# Altium schematic sheet AUDIO - ALC897_3CH.schdoc
size 594 x 421 mm; Symbol: Sheet-Symbol_A2; Company: 嘉立创EDA; Version: V1.0; Page Size: A2; @Project Name: H610(2024/12/09); @Page Count: 36; @Update Date: 2025-10-09; @Create Date: 2025-10-09; @Schematic Name: SCHEMATIC1; @Page No: 20; @Page Name: AUDIO - ALC897_3CH; Device: Sheet-Symbol_A2; @Board Name: SCHEMATIC1; @Create Time: 10:15:41; @Update Time: 10:39:12
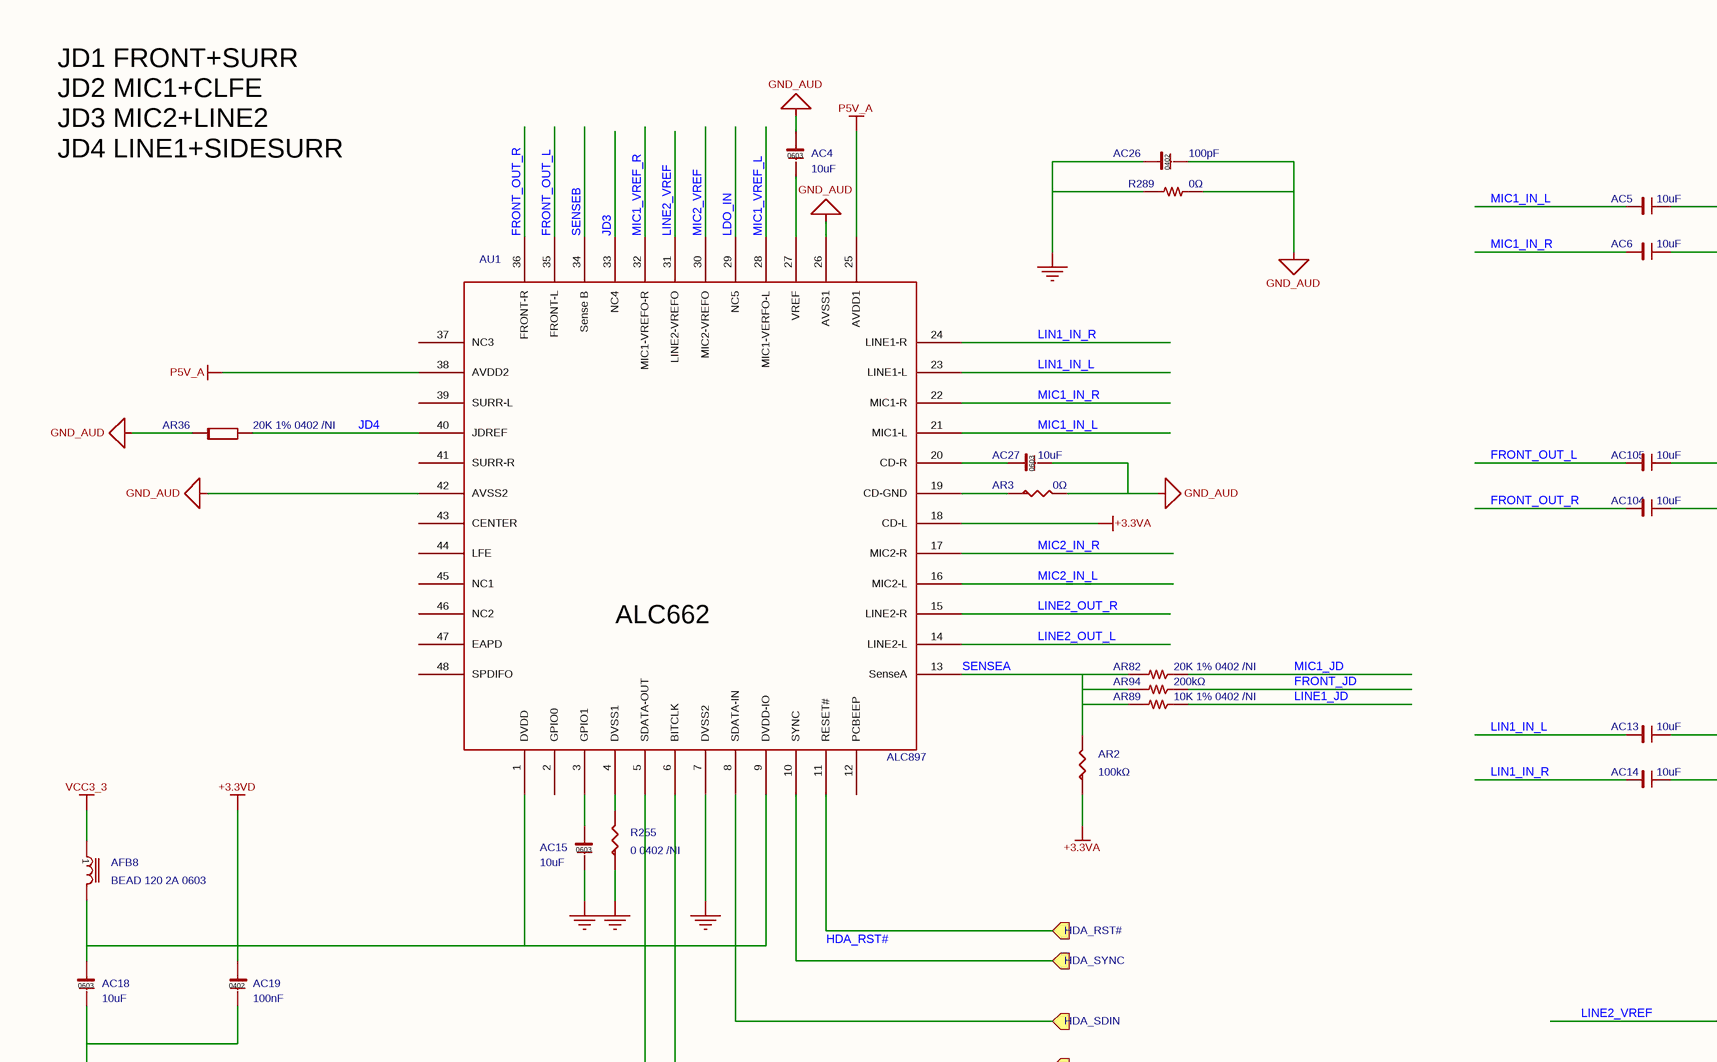
[diagram p0: AUDIO - ALC897_3CH.schdoc, top left]
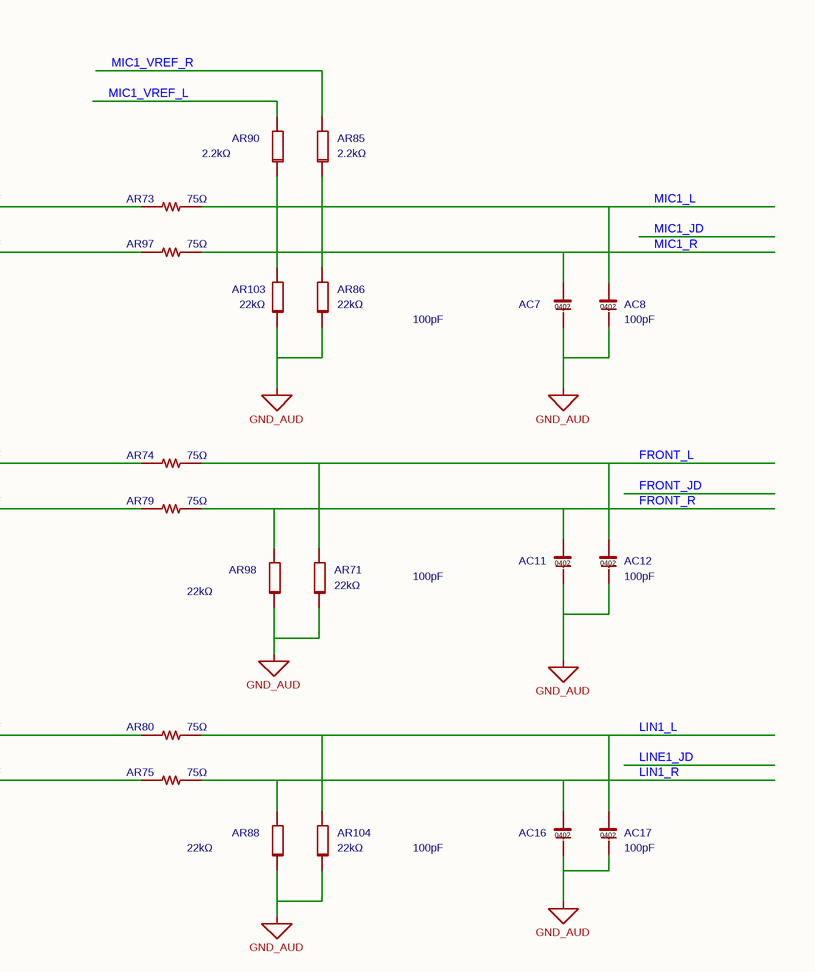
[diagram p1: AUDIO - ALC897_3CH.schdoc, top right]
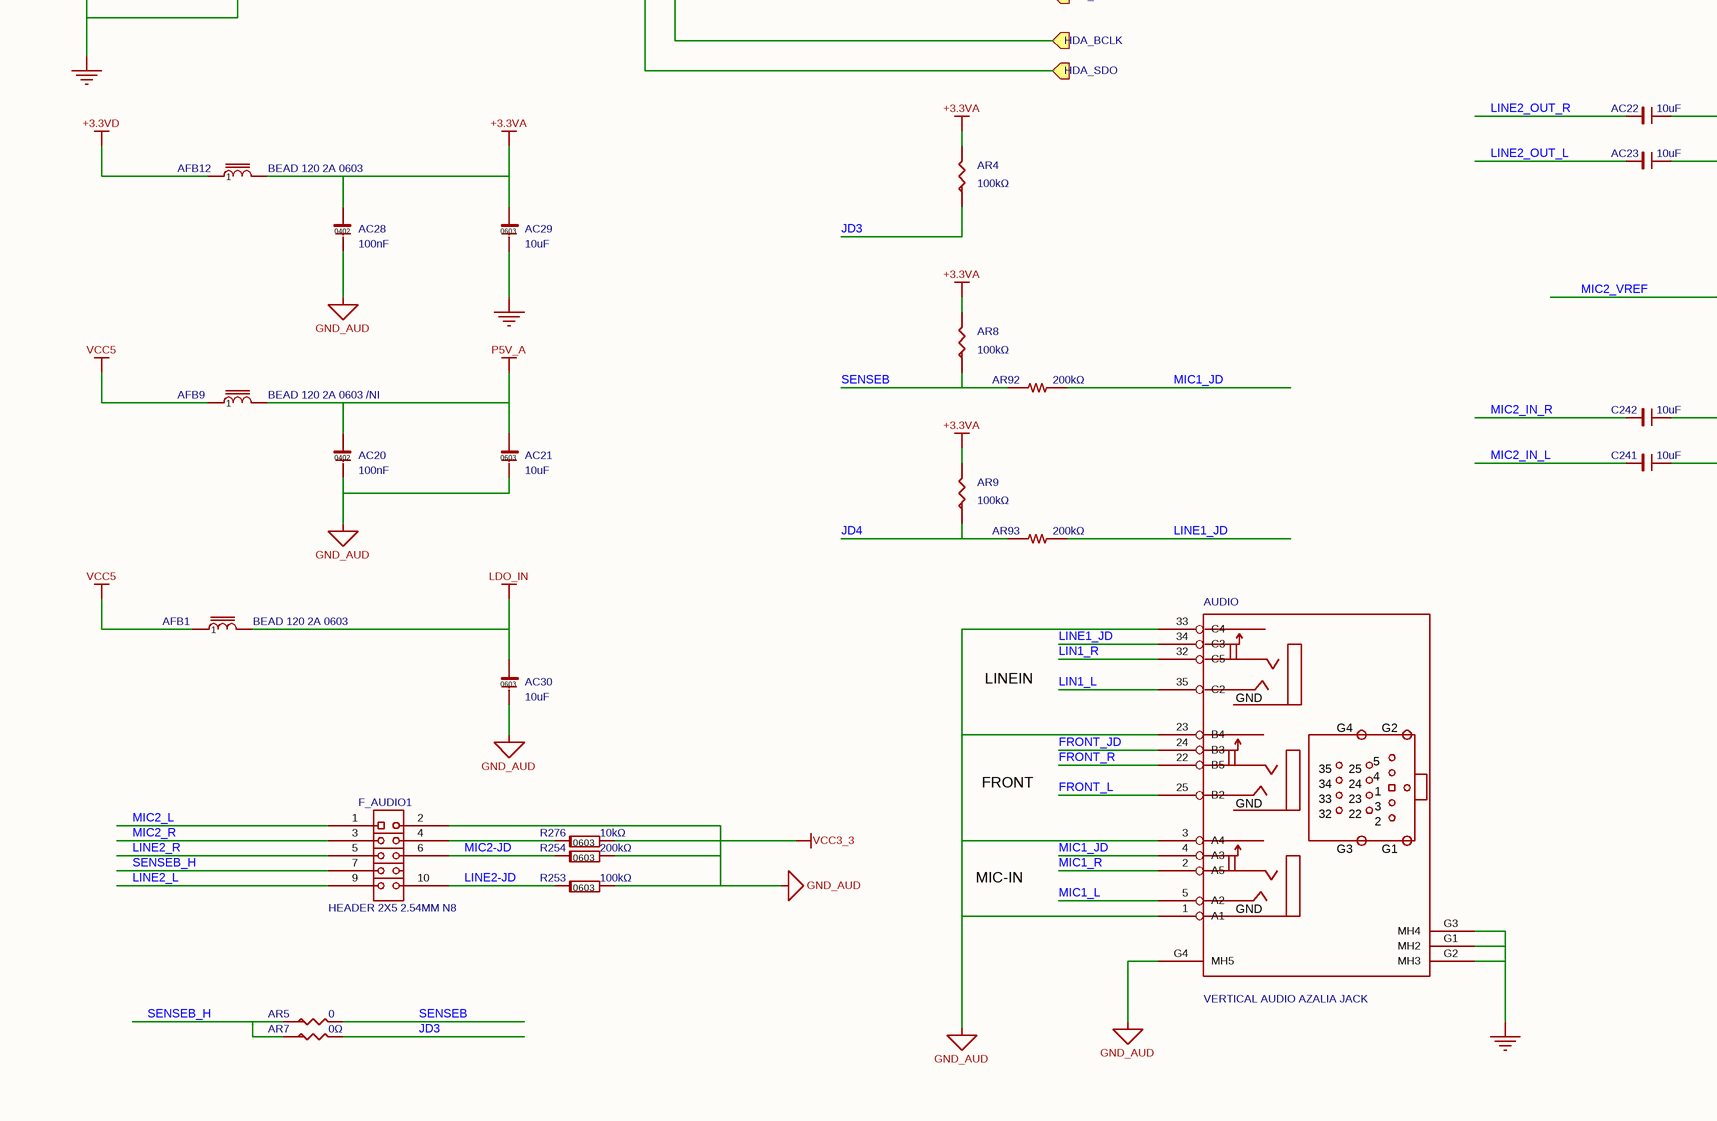
[diagram p2: AUDIO - ALC897_3CH.schdoc, bottom left]
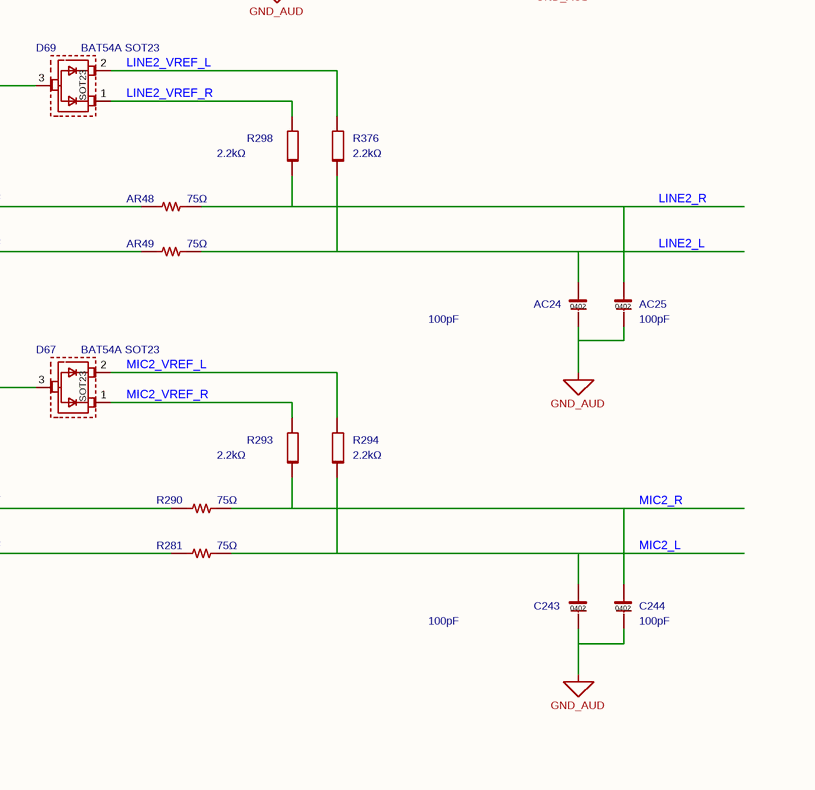
[diagram p3: AUDIO - ALC897_3CH.schdoc, bottom right]

## Parts
AC4  10uF  [C0603]
AC5  10uF  [C0603_1]
AC6  10uF  [C0603_1]
AC7  100pF  [C0402]
AC8  100pF  [C0402_1]
AC11  100pF  [C0402_1]
AC12  100pF  [C0402_1]
AC13  10uF  [C0603_1]
AC14  10uF  [C0603_1]
AC15  10uF  [C0603]
AC16  100pF  [C0402_1]
AC17  100pF  [C0402_1]
AC18  10uF  [C0603]
AC19  100nF  [C0402]
AC20  100nF  [C0402_2]
AC21  10uF  [C0603_2]
AC22  10uF  [C0603_1]
AC23  10uF  [C0603_1]
AC24  100pF  [C0402_2]
AC25  100pF  [C0402_2]
AC26  100pF  [C0402_2]
AC27  10uF  [C0603_1]
AC28  100nF  [C0402_2]
AC29  10uF  [C0603_1]
AC30  10uF  [C0603_3]
AC104  10uF  [C0603_3]
AC105  10uF  [C0603_3]
AFB1  value BEAD 120 2A 0603  [FB0603_2]  (hidden comment: FERRITE BEAD)
AFB8  value BEAD 120 2A 0603  [FB0603]  (hidden comment: FERRITE BEAD)
AFB9  value BEAD 120 2A 0603 /NI  [FB0603_1]  (hidden comment: FERRITE BEAD)
AFB12  value BEAD 120 2A 0603  [FB0603_2]  (hidden comment: FERRITE BEAD)
AR2  100kΩ  [R0402]
AR3  0Ω  [R0402_1]
AR4  100kΩ  [R0402_2]
AR5  value 0  [R0402_2]  (hidden comment: RESISTOR)
AR7  0Ω  [R0402]
AR8  100kΩ  [R0402]
AR9  100kΩ  [R0402_3]
AR36  value 20K 1% 0402 /NI  [R0402_1]  (hidden comment: R0402)
AR48  75Ω  [R0402_3]
AR49  75Ω  [R0402_3]
AR71  22kΩ  [R0402_1]
AR73  75Ω  [R0402_2]
AR74  75Ω  [R0402_3]
AR75  75Ω  [R0402_3]
AR79  75Ω  [R0402_3]
AR80  75Ω  [R0402_3]
AR82  value 20K 1% 0402 /NI  [R0402_2]  (hidden comment: 10_R_0)
AR85  2.2kΩ  [R0402_2]
AR86  22kΩ  [R0402]
AR88  22kΩ  [R0402_1]
AR89  value 10K 1% 0402 /NI  [R0402_2]  (hidden comment: 10_R_0)
AR90  2.2kΩ  [R0402_2]
AR92  200kΩ  [R0402_2]
AR93  200kΩ  [R0402_3]
AR94  200kΩ  [R0402_2]
AR97  75Ω  [R0402_2]
AR98  22kΩ  [R0402_1]
AR103  22kΩ  [R0402_2]
AR104  22kΩ  [R0402_1]
AU1  value ALC897  [LQFP48]  (hidden comment: ALC662_1)
AUDIO  value VERTICAL AUDIO AZALIA JACK  [AUDIO_V]  (hidden comment: ABA-JAK-027-K24)
C241  10uF  [C0603_1]
C242  10uF  [C0603_1]
C243  100pF  [C0402_2]
C244  100pF  [C0402_2]
D67  value BAT54A SOT23  [SOT23_124]  (hidden comment: BAT54A)
D69  value BAT54A SOT23  [SOT23_124]  (hidden comment: BAT54A)
F_AUDIO1  value HEADER 2X5 2.54MM N8  [PIN2X5_2D54_NC8]  (hidden comment: 210-82-05GB06)
R253  100kΩ  [R0402_1]
R254  200kΩ  [R0402_1]
R255  value 0 0402 /NI  [R0402]  (hidden comment: R)
R276  10kΩ  [R0402_1]
R281  75Ω  [R0402_3]
R289  0Ω  [R0603_2]
R290  75Ω  [R0402_3]
R293  2.2kΩ  [R0402]
R294  2.2kΩ  [R0402]
R298  2.2kΩ  [R0402]
R376  2.2kΩ  [R0402]

## Ports
HDA_BCLK (in), HDA_RST# (in), HDA_SDIN (in), HDA_SDO (in), HDA_SYNC (in)

## Nets
+3.3VA: AC28.1 AC29.1 AFB12.2 AR2.1 AR4.2 AR8.2 AR9.2 AU1.18(CD-L)
+3.3VD: AC18.1 AC19.1 AFB8.2 AFB12.1 AU1.1(DVDD) AU1.9(DVDD-IO)
GND: AC15.2 AC18.2 AC19.2 AC26.1 AC29.2 AU1.7(DVSS2) AUDIO.G1(MH2) AUDIO.G2(MH3) AUDIO.G3(MH4) R255.1 R289.1
GND_AUD: AC4.1 AC7.2 AC8.2 AC11.2 AC12.2 AC16.2 AC17.2 AC20.2 AC21.2 AC24.2 AC25.2 AC26.2 AC27.2 AC28.2 AC30.2 AR3.2 AR36.1 AR71.1 AR86.1 AR88.1 AR98.1 AR103.1 AR104.1 AU1.26(AVSS1) AU1.42(AVSS2) AUDIO.1(A1) AUDIO.3(A4) AUDIO.23(B4) AUDIO.33(C4) AUDIO.G4(MH5) C243.2 C244.2 F_AUDIO1.2 R253.2 R254.2 R289.2
LDO_IN: AC30.1 AFB1.2 AU1.29(NC5)
P5V_A: AC20.1 AC21.1 AFB9.2 AU1.25(AVDD1) AU1.38(AVDD2)
VCC3_3: AFB8.1 R276.2
VCC5: AFB1.1 AFB9.1
FRONT_JD: AR94.2 AUDIO.24(B3)
FRONT_L: AC12.1 AR71.2 AR74.1 AUDIO.25(B2)
FRONT_OUT_L: AC105.1 AU1.35(FRONT-L)
FRONT_OUT_R: AC104.1 AU1.36(FRONT-R)
FRONT_R: AC11.1 AR79.1 AR98.2 AUDIO.22(B5)
HDA_BCLK: AU1.6(BITCLK) ; port HDA_BCLK
HDA_RST#: AU1.11(RESET#) ; port HDA_RST#
HDA_SDIN: AU1.8(SDATA-IN) ; port HDA_SDIN
HDA_SDO: AU1.5(SDATA-OUT) ; port HDA_SDO
HDA_SYNC: AU1.10(SYNC) ; port HDA_SYNC
JD3: AR4.1 AR7.2 AU1.33(NC4)
JD4: AR9.1 AR36.2 AR93.1 AU1.40(JDREF)
LIN1_IN_L: AC13.1 AU1.23(LINE1-L)
LIN1_IN_R: AC14.1 AU1.24(LINE1-R)
LIN1_L: AC17.1 AR80.1 AR104.2 AUDIO.35(C2)
LIN1_R: AC16.1 AR75.1 AR88.2 AUDIO.32(C5)
LINE1_JD: AR89.2 AR93.2 AUDIO.34(C3)
LINE2-JD: F_AUDIO1.10 R253.1
LINE2_L: AC24.1 AR49.1 F_AUDIO1.9 R376.1
LINE2_OUT_L: AC23.1 AU1.14(LINE2-L)
LINE2_OUT_R: AC22.1 AU1.15(LINE2-R)
LINE2_R: AC25.1 AR48.1 F_AUDIO1.5 R298.1
LINE2_VREF: AU1.31(LINE2-VREFO) D69.3
LINE2_VREF_L: D69.2 R376.2
LINE2_VREF_R: D69.1 R298.2
MIC1_IN_L: AC5.1 AU1.21(MIC1-L)
MIC1_IN_R: AC6.1 AU1.22(MIC1-R)
MIC1_JD: AR82.2 AR92.2 AUDIO.4(A3)
MIC1_L: AC8.1 AR73.1 AR90.1 AR103.2 AUDIO.5(A2)
MIC1_R: AC7.1 AR85.1 AR86.2 AR97.1 AUDIO.2(A5)
MIC1_VREF_L: AR90.2 AU1.28(MIC1-VERFO-L)
MIC1_VREF_R: AR85.2 AU1.32(MIC1-VREFO-R)
MIC2-JD: F_AUDIO1.6 R254.1
MIC2_IN_L: AU1.16(MIC2-L) C241.1
MIC2_IN_R: AU1.17(MIC2-R) C242.1
MIC2_L: C243.1 F_AUDIO1.1 R281.1 R294.1
MIC2_R: C244.1 F_AUDIO1.3 R290.1 R293.1
MIC2_VREF: AU1.30(MIC2-VREFO) D67.3
MIC2_VREF_L: D67.2 R294.2
MIC2_VREF_R: D67.1 R293.2
SENSEA: AR2.2 AR82.1 AR89.1 AR94.1 AU1.13(SenseA)
SENSEB: AR5.2 AR8.1 AR92.1 AU1.34(Sense_B)
SENSEB_H: AR5.1 AR7.1 F_AUDIO1.7
NetAC4_2: AC4.2 AU1.27(VREF)
NetAC5_2: AC5.2 AR73.2
NetAC6_2: AC6.2 AR97.2
NetAC13_2: AC13.2 AR80.2
NetAC14_2: AC14.2 AR75.2
NetAC15_1: AC15.1 AU1.3(GPIO1)
NetAC22_2: AC22.2 AR48.2
NetAC23_2: AC23.2 AR49.2
NetAC27_1: AC27.1 AU1.20(CD-R)
NetAC104_2: AC104.2 AR79.2
NetAC105_2: AC105.2 AR74.2
NetAR3_1: AR3.1 AU1.19(CD-GND)
NetAU1_4: AU1.4(DVSS1) R255.2
NetC241_2: C241.2 R281.2
NetC242_2: C242.2 R290.2
NetF_AUDIO1_4: F_AUDIO1.4 R276.1

Not connected (* = marked no-connect by the designer): AU1 2(GPIO0) 12(PCBEEP) 37(NC3) 39(SURR-L) 41(SURR-R) 43(CENTER) 44(LFE) 45(NC1) 46(NC2) 47(EAPD) 48(SPDIFO)

## Notes on the sheet
- JD1 FRONT+SURR
  JD2 MIC1+CLFE
  JD3 MIC2+LINE2
  JD4 LINE1+SIDESURR
- LINEIN
- FRONT
- MIC-IN
- 更新日期
- 2025-10-09
- 原理图
- 图页
- SCHEMATIC1
- AUDIO - ALC897_3CH
- 创建日期
- 物料编码
- 审阅
- 绘制
- H610(2024/12/09)
- 版本
- V1.0
- 尺寸
- A2
- 页
- 20
- 嘉立创EDA
- 共
- 36
- (in symbol 0402WGF1002TCE) 0603
- (in symbol 0402WGF1003TCE) 0603
- (in symbol 0402WGF2003TCE) 0603
- (in symbol ABA-JAK-027-K24) GND
- (in symbol ALC662_1) ALC662
- (in symbol BAT54A_C727124) SOT23
- (in symbol CL05A106MQ5NUNC) 0603

## Library data of the parts
AC4 AC15 AC18 = CL05A106MQ5NUNC: 容值:10uF;精度:±20%;额定电压:6.3V;材质(温度系数):X5R;; Manufacturer: SAMSUNG(三星); ModelId: 36a51122f27c49738f86b3bfa98863e0; Tolerance: ±20%; AddInBom: yes; Voltage Rated: 6.3V; ModelName: C0402_L1.0-W0.5-H0.5; ModelTransform: 39.37,19.685,0,0,0,0,0,0,0; Temperature Coefficient: X5R; Device: CL05A106MQ5NUNC; Symbol: C0603; Value: 10uF; Supplier: LCSC; Datasheet: https://atta.szlcsc.com/upload/public/pdf/source/20220823/2B02EE04F8F211D38A52DCB16EB6BEBA.pdf; FootprintName: C0603; SupplierPart: C15525; ConvertToPcb: yes; LCSC Part Name: 10uF ±20% 6.3V; JLCPCB Part Class: Basic Part; ManufacturerPart: CL05A106MQ5NUNC; Supplier Footprint: 0402
AC5 AC6 AC13 AC14 AC22 AC23 AC104 AC105 C241 C242 = CL10A106KP8NNNC: 容值:10uF;精度:±10%;额定电压:10V;材质(温度系数):X5R;; Manufacturer: SAMSUNG(三星); Symbol: C0805; ModelId: ac125912035d415993ca9572d50418b1; Tolerance: ±10%; AddInBom: yes; Voltage Rated: 10V; ModelName: C0603_L1.6-W0.8-H0.8; ModelTransform: 62.992,31.496,0,0,0,0,0,0,0; Temperature Coefficient: X5R; Device: CL10A106KP8NNNC; Value: 10uF; Supplier: LCSC; Datasheet: https://atta.szlcsc.com/upload/public/pdf/source/20160103/1457707703378.pdf; SupplierPart: C19702; ConvertToPcb: yes; LCSC Part Name: 10uF ±10% 10V; JLCPCB Part Class: Basic Part; ManufacturerPart: CL10A106KP8NNNC; Supplier Footprint: 0603
  AC5 AC6 AC13 AC14 AC22 AC23 C241 C242: FootprintName: C0603_1
  AC104 AC105: FootprintName: C0603_3
AC7 = 0402CG101J500NT: 容值:100pF;精度:±5%;额定电压:50V;材质(温度系数):C0G;; Manufacturer: FH(风华); ModelId: 36a51122f27c49738f86b3bfa98863e0; Tolerance: ±5%; AddInBom: yes; Voltage Rated: 50V; ModelName: C0402_L1.0-W0.5-H0.5; ModelTransform: 39.37,19.685,0,0,0,0,0,0,0; Temperature Coefficient: C0G; Device: 0402CG101J500NT; Symbol: C0402; Value: 100pF; Supplier: LCSC; FootprintName: C0402; SupplierPart: C1546; ConvertToPcb: yes; LCSC Part Name: 100pF ±5% 50V; JLCPCB Part Class: Basic Part; ManufacturerPart: 0402CG101J500NT; Supplier Footprint: 0402
AC8 AC11 AC12 AC16 AC17 AC24-AC26 C243 C244 = 0402CG101J500NT: 容值:100pF;精度:±5%;额定电压:50V;材质(温度系数):C0G;; Manufacturer: FH(风华); Symbol: C0402; ModelId: 36a51122f27c49738f86b3bfa98863e0; Tolerance: ±5%; AddInBom: yes; Voltage Rated: 50V; ModelName: C0402_L1.0-W0.5-H0.5; ModelTransform: 39.37,19.685,0,0,0,0,0,0,0; Temperature Coefficient: C0G; Device: 0402CG101J500NT; Value: 100pF; Supplier: LCSC; SupplierPart: C1546; ConvertToPcb: yes; LCSC Part Name: 100pF ±5% 50V; JLCPCB Part Class: Basic Part; ManufacturerPart: 0402CG101J500NT; Supplier Footprint: 0402
  AC8 AC11 AC12 AC16 AC17: FootprintName: C0402_1
  AC24-AC26 C243 C244: FootprintName: C0402_2
AC19 = CL05B104KO5NNNC: 容值:100nF;精度:±10%;额定电压:16V;材质(温度系数):X7R;; Manufacturer: SAMSUNG(三星); ModelId: 36a51122f27c49738f86b3bfa98863e0; Tolerance: ±10%; AddInBom: yes; Voltage Rated: 16V; ModelName: C0402_L1.0-W0.5-H0.5; ModelTransform: 39.37,19.685,0,0,0,0,0,0,0; Temperature Coefficient: X7R; Device: CL05B104KO5NNNC; Symbol: C0402; Value: 100nF; Supplier: LCSC; Datasheet: https://atta.szlcsc.com/upload/public/pdf/source/20160103/1457707674891.pdf; FootprintName: C0402; SupplierPart: C1525; ConvertToPcb: yes; LCSC Part Name: 100nF ±10% 16V; JLCPCB Part Class: Basic Part; ManufacturerPart: CL05B104KO5NNNC; Supplier Footprint: 0402
AC20 AC28 = CL05B104KO5NNNC: 容值:100nF;精度:±10%;额定电压:16V;材质(温度系数):X7R;; Manufacturer: SAMSUNG(三星); Symbol: C0402; ModelId: 36a51122f27c49738f86b3bfa98863e0; Tolerance: ±10%; AddInBom: yes; Voltage Rated: 16V; ModelName: C0402_L1.0-W0.5-H0.5; ModelTransform: 39.37,19.685,0,0,0,0,0,0,0; Temperature Coefficient: X7R; Device: CL05B104KO5NNNC; Value: 100nF; Supplier: LCSC; Datasheet: https://atta.szlcsc.com/upload/public/pdf/source/20160103/1457707674891.pdf; FootprintName: C0402_2; SupplierPart: C1525; ConvertToPcb: yes; LCSC Part Name: 100nF ±10% 16V; JLCPCB Part Class: Basic Part; ManufacturerPart: CL05B104KO5NNNC; Supplier Footprint: 0402
AC21 AC27 AC29 AC30 = CL05A106MQ5NUNC: 容值:10uF;精度:±20%;额定电压:6.3V;材质(温度系数):X5R;; Manufacturer: SAMSUNG(三星); Symbol: C0603; ModelId: 36a51122f27c49738f86b3bfa98863e0; Tolerance: ±20%; AddInBom: yes; Voltage Rated: 6.3V; ModelName: C0402_L1.0-W0.5-H0.5; ModelTransform: 39.37,19.685,0,0,0,0,0,0,0; Temperature Coefficient: X5R; Device: CL05A106MQ5NUNC; Value: 10uF; Supplier: LCSC; Datasheet: https://atta.szlcsc.com/upload/public/pdf/source/20220823/2B02EE04F8F211D38A52DCB16EB6BEBA.pdf; SupplierPart: C15525; ConvertToPcb: yes; LCSC Part Name: 10uF ±20% 6.3V; JLCPCB Part Class: Basic Part; ManufacturerPart: CL05A106MQ5NUNC; Supplier Footprint: 0402
  AC21: FootprintName: C0603_2
  AC27 AC29: FootprintName: C0603_1
  AC30: FootprintName: C0603_3
AFB1 AFB12 = FERRITE BEAD: Check: false; AddInBom: yes; Device: FERRITE BEAD; Symbol: FERRITE BEAD; FootprintName: FB0603_2; ConvertToPcb: yes
AFB8 = FERRITE BEAD_1: Check: false; AddInBom: yes; Device: FERRITE BEAD_1; Symbol: FERRITE BEAD; FootprintName: FB0603; ConvertToPcb: yes
AFB9 = FERRITE BEAD_2: BEAD 120 2A 0603 /NI; Check: false; AddInBom: yes; Device: FERRITE BEAD_2; Symbol: FERRITE BEAD; FootprintName: FB0603_1; ConvertToPcb: yes
AR2 AR4 AR8 AR9 = 0402WGF1003TCE: 电阻类型:厚膜电阻;阻值:100kΩ;精度:±1%;功率:62.5mW;; Manufacturer: UNI-ROYAL(厚声); Symbol: RESISTOR; ModelId: 671aefced39d4c318694bba8bd8efd39; Tolerance: ±1%; AddInBom: yes; Power(Watts): 62.5mW; ModelName: R0402_L1.0-W0.5-H0.5; ModelTransform: 39.37,19.685,0,0,0,0,0,0.0005,0; Overload Voltage (Max): 50V; Temperature Coefficient: ±100ppm/℃; Device: 0402WGF1003TCE; Value: 100kΩ; Type: 厚膜电阻; Supplier: LCSC; Datasheet: https://atta.szlcsc.com/upload/public/pdf/source/20200306/C422600_1E6D84923E4A46A82E41ADD87F860B5C.pdf; SupplierPart: C25741; ConvertToPcb: yes; LCSC Part Name: 100kΩ ±1% 62.5mW; JLCPCB Part Class: Basic Part; ManufacturerPart: 0402WGF1003TCE; Supplier Footprint: 0402; Operating Temperature Range: -55℃~+155℃
  AR2 AR8: FootprintName: R0402
  AR4: FootprintName: R0402_2
  AR9: FootprintName: R0402_3
AR3 AR7 = 0402WGF0000TCE: 电阻类型:厚膜电阻;阻值:0Ω;精度:±1%;功率:62.5mW;; Manufacturer: UNI-ROYAL(厚声); Symbol: RESISTOR; ModelId: 671aefced39d4c318694bba8bd8efd39; Tolerance: ±1%; AddInBom: yes; Power(Watts): 62.5mW; ModelName: R0402_L1.0-W0.5-H0.5; ModelTransform: 39.37,19.685,0,0,0,0,0,0.0005,0; Overload Voltage (Max): 50V; Temperature Coefficient: ±800ppm/℃; Device: 0402WGF0000TCE; Value: 0Ω; Type: 厚膜电阻; Supplier: LCSC; Datasheet: https://atta.szlcsc.com/upload/public/pdf/source/20200306/C422600_1E6D84923E4A46A82E41ADD87F860B5C.pdf; SupplierPart: C17168; ConvertToPcb: yes; LCSC Part Name: 0Ω ±1% 62.5mW; JLCPCB Part Class: Basic Part; ManufacturerPart: 0402WGF0000TCE; Supplier Footprint: 0402; Operating Temperature Range: -55℃~+155℃
  AR3: FootprintName: R0402_1
  AR7: FootprintName: R0402
AR5 = RESISTOR: 0 0402 /NI 选焊; Check: false; AddInBom: yes; Device: RESISTOR; Symbol: RESISTOR; FootprintName: R0402_2; ConvertToPcb: yes
AR36 = R0402: 20K 1% 0402 /NI; Check: false; AddInBom: yes; Device: R0402; Symbol: R0402; ConvertToPcb: yes; FootprintName: R0402_1
AR48 AR49 AR73-AR75 AR79 AR80 AR97 R281 R290 = 0402WGF750JTCE: 电阻类型:厚膜电阻;阻值:75Ω;精度:±1%;功率:62.5mW;; Manufacturer: UNI-ROYAL(厚声); Symbol: R_3; ModelId: 671aefced39d4c318694bba8bd8efd39; Tolerance: ±1%; AddInBom: yes; Power(Watts): 62.5mW; ModelName: R0402_L1.0-W0.5-H0.5; ModelTransform: 39.37,19.685,0,0,0,0,0,0.0005,0; Overload Voltage (Max): 50V; Temperature Coefficient: ±100ppm/℃; Device: 0402WGF750JTCE; Value: 75Ω; Type: 厚膜电阻; Supplier: LCSC; Datasheet: https://atta.szlcsc.com/upload/public/pdf/source/20200306/C422600_1E6D84923E4A46A82E41ADD87F860B5C.pdf; SupplierPart: C25133; ConvertToPcb: yes; LCSC Part Name: 75Ω ±1% 62.5mW; JLCPCB Part Class: Basic Part; ManufacturerPart: 0402WGF750JTCE; Supplier Footprint: 0402; Operating Temperature Range: -55℃~+155℃
  AR48 AR49 AR74 AR75 AR79 AR80 R281 R290: FootprintName: R0402_3
  AR73 AR97: FootprintName: R0402_2
AR71 AR88 AR98 AR103 AR104 = 0402WGF2202TCE: 电阻类型:厚膜电阻;阻值:22kΩ;精度:±1%;功率:62.5mW;; Manufacturer: UNI-ROYAL(厚声); Symbol: R0402; ModelId: 671aefced39d4c318694bba8bd8efd39; Tolerance: ±1%; AddInBom: yes; Power(Watts): 62.5mW; ModelName: R0402_L1.0-W0.5-H0.5; ModelTransform: 39.37,19.685,0,0,0,0,0,0.0005,0; Overload Voltage (Max): 50V; Temperature Coefficient: ±100ppm/℃; Device: 0402WGF2202TCE; Value: 22kΩ; Type: 厚膜电阻; Supplier: LCSC; Datasheet: https://atta.szlcsc.com/upload/public/pdf/source/20200306/C422600_1E6D84923E4A46A82E41ADD87F860B5C.pdf; SupplierPart: C25768; ConvertToPcb: yes; LCSC Part Name: 22kΩ ±1% 62.5mW; JLCPCB Part Class: Basic Part; ManufacturerPart: 0402WGF2202TCE; Supplier Footprint: 0402; Operating Temperature Range: -55℃~+155℃
  AR71 AR88 AR98 AR104: FootprintName: R0402_1
  AR103: FootprintName: R0402_2
AR82 = 10_R_0: Check: false; AddInBom: yes; Device: 10_R_0; Symbol: 10_R_0; FootprintName: R0402_2; ConvertToPcb: yes
AR85 AR90 = 0402WGF2201TCE: 电阻类型:厚膜电阻;阻值:2.2kΩ;精度:±1%;功率:62.5mW;; Manufacturer: UNI-ROYAL(厚声); Symbol: R0402; ModelId: 671aefced39d4c318694bba8bd8efd39; Tolerance: ±1%; AddInBom: yes; Power(Watts): 62.5mW; ModelName: R0402_L1.0-W0.5-H0.5; ModelTransform: 39.37,19.685,0,0,0,0,0,0.0005,0; Overload Voltage (Max): 50V; Temperature Coefficient: ±100ppm/℃; Device: 0402WGF2201TCE; Value: 2.2kΩ; Type: 厚膜电阻; Supplier: LCSC; Datasheet: https://atta.szlcsc.com/upload/public/pdf/source/20200306/C422600_1E6D84923E4A46A82E41ADD87F860B5C.pdf; FootprintName: R0402_2; SupplierPart: C25879; ConvertToPcb: yes; LCSC Part Name: 2.2kΩ ±1% 62.5mW; JLCPCB Part Class: Basic Part; ManufacturerPart: 0402WGF2201TCE; Supplier Footprint: 0402; Operating Temperature Range: -55℃~+155℃
AR86 = 0402WGF2202TCE: 电阻类型:厚膜电阻;阻值:22kΩ;精度:±1%;功率:62.5mW;; Manufacturer: UNI-ROYAL(厚声); ModelId: 671aefced39d4c318694bba8bd8efd39; Tolerance: ±1%; AddInBom: yes; Power(Watts): 62.5mW; ModelName: R0402_L1.0-W0.5-H0.5; ModelTransform: 39.37,19.685,0,0,0,0,0,0.0005,0; Overload Voltage (Max): 50V; Temperature Coefficient: ±100ppm/℃; Device: 0402WGF2202TCE; Symbol: R0402; Value: 22kΩ; Type: 厚膜电阻; Supplier: LCSC; Datasheet: https://atta.szlcsc.com/upload/public/pdf/source/20200306/C422600_1E6D84923E4A46A82E41ADD87F860B5C.pdf; FootprintName: R0402; SupplierPart: C25768; ConvertToPcb: yes; LCSC Part Name: 22kΩ ±1% 62.5mW; JLCPCB Part Class: Basic Part; ManufacturerPart: 0402WGF2202TCE; Supplier Footprint: 0402; Operating Temperature Range: -55℃~+155℃
AR89 = 10_R_0: Manufacturer: UNI-ROYAL(厚声); Manufacturer Part: 0402WGF1002TCE; 3D Model: 671aefced39d4c318694bba8bd8efd39; 3D Model Transform: 39.37,19.685,0,0,0,0,0,0.0005,0; Tolerance: ±1%; Power(Watts): 62.5mW; Overload Voltage (Max): 50V; Temperature Coefficient: ±100ppm/℃; Check: false; AddInBom: yes; Device: 10_R_0; Symbol: 10_R_0; LCSC Part Name: 10kΩ ±1% 62.5mW 厚膜电阻; Supplier Part: C25744; Supplier Footprint: 0402; JLCPCB Part Class: Basic Part; Datasheet: https://atta.szlcsc.com/upload/public/pdf/source/20200306/C422600_1E6D84923E4A46A82E41ADD87F860B5C.pdf; Supplier: LCSC; Type: 厚膜电阻; Operating Temperature Range: -55℃~+155℃; FootprintName: R0402_2; ConvertToPcb: yes
AR92-AR94 = 0402WGF2003TCE: 电阻类型:厚膜电阻;阻值:200kΩ;精度:±1%;功率:62.5mW;; Manufacturer: UNI-ROYAL(厚声); Symbol: 10_R_0; ModelId: 671aefced39d4c318694bba8bd8efd39; Tolerance: ±1%; AddInBom: yes; Power(Watts): 62.5mW; ModelName: R0402_L1.0-W0.5-H0.5; ModelTransform: 39.37,19.685,0,0,0,0,0,0.0005,0; Overload Voltage (Max): 50V; Temperature Coefficient: ±100ppm/℃; Device: 0402WGF2003TCE; Value: 200kΩ; Type: 厚膜电阻; Supplier: LCSC; Datasheet: https://atta.szlcsc.com/upload/public/pdf/source/20200306/C422600_1E6D84923E4A46A82E41ADD87F860B5C.pdf; SupplierPart: C25764; ConvertToPcb: yes; LCSC Part Name: 200kΩ ±1% 62.5mW; JLCPCB Part Class: Basic Part; ManufacturerPart: 0402WGF2003TCE; Supplier Footprint: 0402; Operating Temperature Range: -55℃~+155℃
  AR92 AR94: FootprintName: R0402_2
  AR93: FootprintName: R0402_3
AU1 = ALC662_1: Check: false; AddInBom: yes; Device: ALC662_1; Symbol: ALC662_1; FootprintName: LQFP48; ConvertToPcb: yes
AUDIO = ABA-JAK-027-K24: 连接器类型:3.5mm耳机座;额定电流:-;额定电压:-;工作温度范围:-25℃~+85℃;; Manufacturer: LOTES(嘉澤端子); Symbol: PHONEJACK OPEN SW_0; AddInBom: yes; ModelId: 9c52c713033f4ae592d105a413021057; ModelName: AUDIO-TH_ABA-JAK-027-K11; ModelTransform: 574.802,966.53358,0,0,0,0,-0.005,-90.549,-165.354; Device: ABA-JAK-027-K24; LCSC Part Name: 3.5mm耳机座; SupplierPart: C962118; ManufacturerPart: ABA-JAK-027-K24; Supplier Footprint: 插件; JLCPCB Part Class: 扩展库; Datasheet: https://atta.szlcsc.com/upload/public/pdf/source/20201125/C962118_19A1289A010465396137572C9F53A68A.pdf; Supplier: LCSC; ConvertToPcb: yes; FootprintName: AUDIO_V; Connector Type: 3.5mm耳机座; Current Rating (Max): -; Voltage Rating (Max): -; Operating Temperature Range: -25℃~+85℃
D67 D69 = BAT54A_C727124: 二极管配置:1对共阳极;正向压降(Vf):1V@100mA;直流反向耐压(Vr):30V;平均整流电流(Io):200mA;; Manufacturer: TWGMC(台湾迪嘉); AddInBom: yes; ModelId: c62791f0466c4ae2a892c056b845b0ca; ModelName: SOT-23-3P_L2.9-W1.3-H1.0-LS2.4-P0.95; ModelTransform: 98.425,114.173,0,180,0,0,0.0005,-0.0005,0; Diode Configuration: 1对共阳极; Reverse Voltage (Vr): 30V; Average Rectified Current (Io): 200mA; Reverse Leakage Current (Ir): 2uA@25V; Device: BAT54A_C727124; Symbol: BAT54A; LCSC Part Name: 电压:30V 电流:200mA; SupplierPart: C727124; ManufacturerPart: BAT54A; Supplier Footprint: SOT-23; JLCPCB Part Class: Extended Part; Datasheet: https://atta.szlcsc.com/upload/public/pdf/source/20200827/C727124_5D482B6B1AEFE8F49931502BEAC75010.pdf; Supplier: LCSC; ConvertToPcb: yes; FootprintName: SOT23_124; Forward Voltage (Vf@If): 1V@100mA
F_AUDIO1 = 210-82-05GB06: 插针结构:2x5P;间距:2.54mm;行距:2.54mm;圆针/方针:方针;安装类型:直插;排数:双排;总PIN位数:10P;额定电流:3A;额定电压:-;配合针长度:6.1mm;塑高:2.5mm;端接针长度:3mm;触头材质:黄铜;触头镀层:-;工作温度范围:-40℃~+105℃;颜色:黑色;; Manufacturer: PINREX(频锐科技); Symbol: HEADER_2; AddInBom: yes; ModelId: 62da575dbf8d4f378d360e32527d3dcb; ModelName: HDR-TH_10P-P2.54_210-82-05GB06; ModelTransform: 490.157,196.85,0,0,0,0,0,0,-118.11; Pin Structure: 2x5P; Pitch: 2.54mm; Circluar Pins/Square Pins: 方针; Current Rating (Max): 3A; Device: 210-82-05GB06; LCSC Part Name: 间距:2.54mm 2x5P 直插 方针 黑金; SupplierPart: C390687; ManufacturerPart: 210-82-05GB06; Supplier Footprint: 插件,P=2.54mm; JLCPCB Part Class: 扩展库; Datasheet: https://atta.szlcsc.com/upload/public/pdf/source/20190506/C390687_1FA441D5BA312DF4E77D37F916E9E386.pdf; Supplier: LCSC; ConvertToPcb: yes; FootprintName: PIN2X5_2D54_NC8; Row Spacing: 2.54mm; Mounting Type: 直插; Number of Rows: 双排; Number of Pins: 10P; Voltage Rating (Max): -; Length of Mating Pin: 6.1mm; Insulation Height: 2.5mm; Length of End Connection Pin: 3mm; Contact Material: 黄铜; Contact Plating: -; Operating Temperature Range: -40℃~+105℃; Color: 黑色
R253 = 0402WGF1003TCE: 电阻类型:厚膜电阻;阻值:100kΩ;精度:±1%;功率:62.5mW;; Manufacturer: UNI-ROYAL(厚声); Symbol: R0603; ModelId: 671aefced39d4c318694bba8bd8efd39; Tolerance: ±1%; AddInBom: yes; Power(Watts): 62.5mW; ModelName: R0402_L1.0-W0.5-H0.5; ModelTransform: 39.37,19.685,0,0,0,0,0,0.0005,0; Overload Voltage (Max): 50V; Temperature Coefficient: ±100ppm/℃; Device: 0402WGF1003TCE; Value: 100kΩ; Type: 厚膜电阻; Supplier: LCSC; Datasheet: https://atta.szlcsc.com/upload/public/pdf/source/20200306/C422600_1E6D84923E4A46A82E41ADD87F860B5C.pdf; FootprintName: R0402_1; SupplierPart: C25741; ConvertToPcb: yes; LCSC Part Name: 100kΩ ±1% 62.5mW; JLCPCB Part Class: Basic Part; ManufacturerPart: 0402WGF1003TCE; Supplier Footprint: 0402; Operating Temperature Range: -55℃~+155℃
R254 = 0402WGF2003TCE: 电阻类型:厚膜电阻;阻值:200kΩ;精度:±1%;功率:62.5mW;; Manufacturer: UNI-ROYAL(厚声); Symbol: R0603; ModelId: 671aefced39d4c318694bba8bd8efd39; Tolerance: ±1%; AddInBom: yes; Power(Watts): 62.5mW; ModelName: R0402_L1.0-W0.5-H0.5; ModelTransform: 39.37,19.685,0,0,0,0,0,0.0005,0; Overload Voltage (Max): 50V; Temperature Coefficient: ±100ppm/℃; Device: 0402WGF2003TCE; Value: 200kΩ; Type: 厚膜电阻; Supplier: LCSC; Datasheet: https://atta.szlcsc.com/upload/public/pdf/source/20200306/C422600_1E6D84923E4A46A82E41ADD87F860B5C.pdf; FootprintName: R0402_1; SupplierPart: C25764; ConvertToPcb: yes; LCSC Part Name: 200kΩ ±1% 62.5mW; JLCPCB Part Class: Basic Part; ManufacturerPart: 0402WGF2003TCE; Supplier Footprint: 0402; Operating Temperature Range: -55℃~+155℃
R255 = R: Check: false; AddInBom: yes; Device: R; Symbol: R; FootprintName: R0402; ConvertToPcb: yes
R276 = 0402WGF1002TCE: 电阻类型:厚膜电阻;阻值:10kΩ;精度:±1%;功率:62.5mW;; Manufacturer: UNI-ROYAL(厚声); Symbol: R0603; ModelId: 671aefced39d4c318694bba8bd8efd39; Tolerance: ±1%; AddInBom: yes; Power(Watts): 62.5mW; ModelName: R0402_L1.0-W0.5-H0.5; ModelTransform: 39.37,19.685,0,0,0,0,0,0.0005,0; Overload Voltage (Max): 50V; Temperature Coefficient: ±100ppm/℃; Device: 0402WGF1002TCE; Value: 10kΩ; Type: 厚膜电阻; Supplier: LCSC; Datasheet: https://atta.szlcsc.com/upload/public/pdf/source/20200306/C422600_1E6D84923E4A46A82E41ADD87F860B5C.pdf; FootprintName: R0402_1; SupplierPart: C25744; ConvertToPcb: yes; LCSC Part Name: 10kΩ ±1% 62.5mW; JLCPCB Part Class: Basic Part; ManufacturerPart: 0402WGF1002TCE; Supplier Footprint: 0402; Operating Temperature Range: -55℃~+155℃
R289 = 0603WAF0000T5E: 电阻类型:厚膜电阻;阻值:0Ω;精度:±1%;功率:100mW;; Manufacturer: UNI-ROYAL(厚声); Symbol: 10K; Tolerance: ±1%; ModelId: fc143cca1e79419f9cd78b61e9279f08; AddInBom: yes; Power(Watts): 100mW; ModelName: R0603; ModelTransform: 31.8897,63.7794,0,90,0,0,0,0,0; Overload Voltage (Max): 75V; Device: 0603WAF0000T5E; Value: 0Ω; Type: 厚膜电阻; Supplier: LCSC; Datasheet: https://atta.szlcsc.com/upload/public/pdf/source/20200306/C422600_1E6D84923E4A46A82E41ADD87F860B5C.pdf; FootprintName: R0603_2; SupplierPart: C21189; ConvertToPcb: yes; LCSC Part Name: 0Ω ±1% 100mW; JLCPCB Part Class: Basic Part; ManufacturerPart: 0603WAF0000T5E; Supplier Footprint: 0603; Operating Temperature Range: -55℃~+155℃
R293 R294 R298 R376 = 0402WGF2201TCE: 电阻类型:厚膜电阻;阻值:2.2kΩ;精度:±1%;功率:62.5mW;; Manufacturer: UNI-ROYAL(厚声); ModelId: 671aefced39d4c318694bba8bd8efd39; Tolerance: ±1%; AddInBom: yes; Power(Watts): 62.5mW; ModelName: R0402_L1.0-W0.5-H0.5; ModelTransform: 39.37,19.685,0,0,0,0,0,0.0005,0; Overload Voltage (Max): 50V; Temperature Coefficient: ±100ppm/℃; Device: 0402WGF2201TCE; Symbol: R0402; Value: 2.2kΩ; Type: 厚膜电阻; Supplier: LCSC; Datasheet: https://atta.szlcsc.com/upload/public/pdf/source/20200306/C422600_1E6D84923E4A46A82E41ADD87F860B5C.pdf; FootprintName: R0402; SupplierPart: C25879; ConvertToPcb: yes; LCSC Part Name: 2.2kΩ ±1% 62.5mW; JLCPCB Part Class: Basic Part; ManufacturerPart: 0402WGF2201TCE; Supplier Footprint: 0402; Operating Temperature Range: -55℃~+155℃